# Altium schematic sheet Connector.SchDoc
size A3; SheetNumber: 7; SheetTotal: 7

## Notes on the sheet
- Project:
- Subsystem:
- Company:
- Document:
- Author:
- Revision:
- Date:
- Sheet:
- /